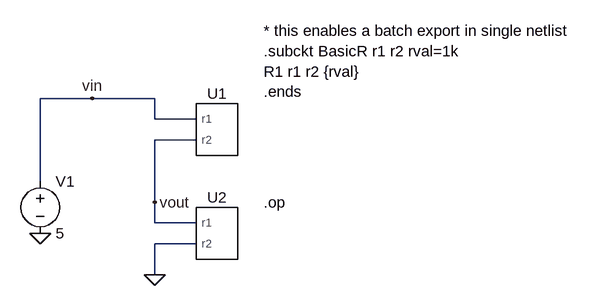
[diagram p0: schematic r_divider_subckt.asc]
r_divider_subckt.asc, the LTspice schematic file:
Version 4.1
SHEET 1 1012 680
WIRE 224 -16 144 -16
WIRE 320 -16 224 -16
WIRE 320 16 320 -16
WIRE 384 16 320 16
WIRE 384 48 320 48
WIRE 144 112 144 -16
WIRE 320 144 320 48
WIRE 320 176 320 144
WIRE 384 176 320 176
WIRE 384 208 320 208
WIRE 320 256 320 208
FLAG 144 192 0
FLAG 320 256 0
FLAG 224 -16 vin
FLAG 320 144 vout
SYMBOL voltage 144 96 R0
WINDOW 123 0 0 Left 0
WINDOW 39 0 0 Left 0
SYMATTR InstName V1
SYMATTR Value 5
SYMBOL r_subckt 416 32 M0
SYMATTR InstName U1
SYMBOL r_subckt 416 192 M0
SYMATTR InstName U2
SYMATTR SpiceLine rval=4.7k
TEXT 488 144 Left 2 !.op
TEXT 488 -120 Left 2 !* this enables a batch export in single netlist\n.subckt BasicR r1 r2 rval=1k\nR1 r1 r2 {rval}\n.ends

The netlist it stands for:
* r_divider_subckt.asc
V1 vin 0 5
X§U1 vin vout BasicR rval=1k  ; pins r1 r2
X§U2 vout 0 BasicR rval=4.7k  ; pins r1 r2
.op
* this enables a batch export in single netlist
.subckt BasicR r1 r2 rval=1k
R1 r1 r2 {rval}
.ends
.backanno
.end